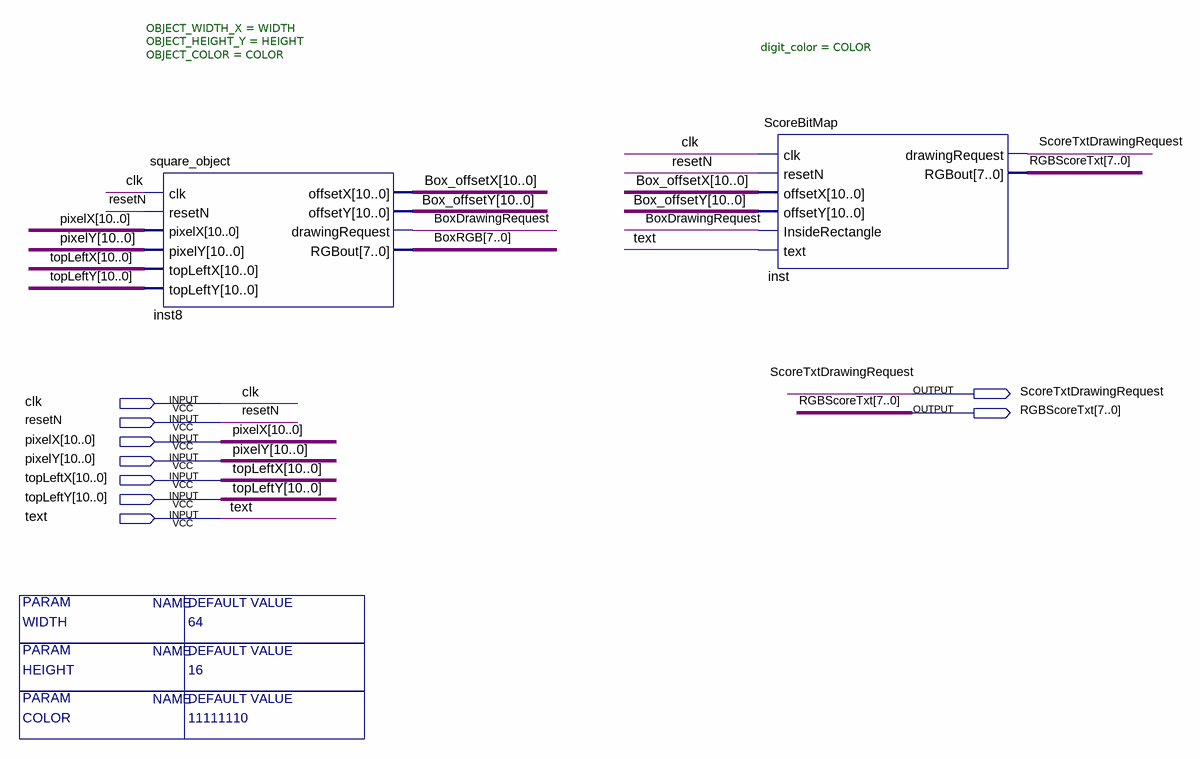
[diagram p0: schematic sheet]
// Quartus schematic Score.bdf as structural Verilog: 2 symbols, 9 pins
module Score #(parameter COLOR = 11111110, parameter HEIGHT = 16, parameter WIDTH = 64) (
  input  clk,
  input  resetN,
  input  [10:0] pixelX,
  input  [10:0] pixelY,
  input  [10:0] topLeftX,
  input  [10:0] topLeftY,
  input  text,
  output ScoreTxtDrawingRequest,
  output [7:0] RGBScoreTxt
);

  wire BoxDrawingRequest;
  wire [7:0] BoxRGB;
  wire [10:0] Box_offsetX, Box_offsetY;

  square_object #(.OBJECT_WIDTH_X(WIDTH), .OBJECT_HEIGHT_Y(HEIGHT), .OBJECT_COLOR(COLOR)) inst8 (
    .clk(clk), .resetN(resetN), .pixelX(pixelX), .pixelY(pixelY), .topLeftX(topLeftX), .topLeftY(topLeftY),
    .offsetX(Box_offsetX), .offsetY(Box_offsetY), .drawingRequest(BoxDrawingRequest), .RGBout(BoxRGB));
  ScoreBitMap #(.digit_color(COLOR)) inst (
    .clk(clk), .resetN(resetN), .offsetX(Box_offsetX), .offsetY(Box_offsetY),
    .InsideRectangle(BoxDrawingRequest), .text(text), .drawingRequest(ScoreTxtDrawingRequest),
    .RGBout(RGBScoreTxt));
endmodule
